# Altium schematic sheet 07_Storage.SchDoc
size 812 x 508 mm; SheetNumber: 7; SheetTotal: 16
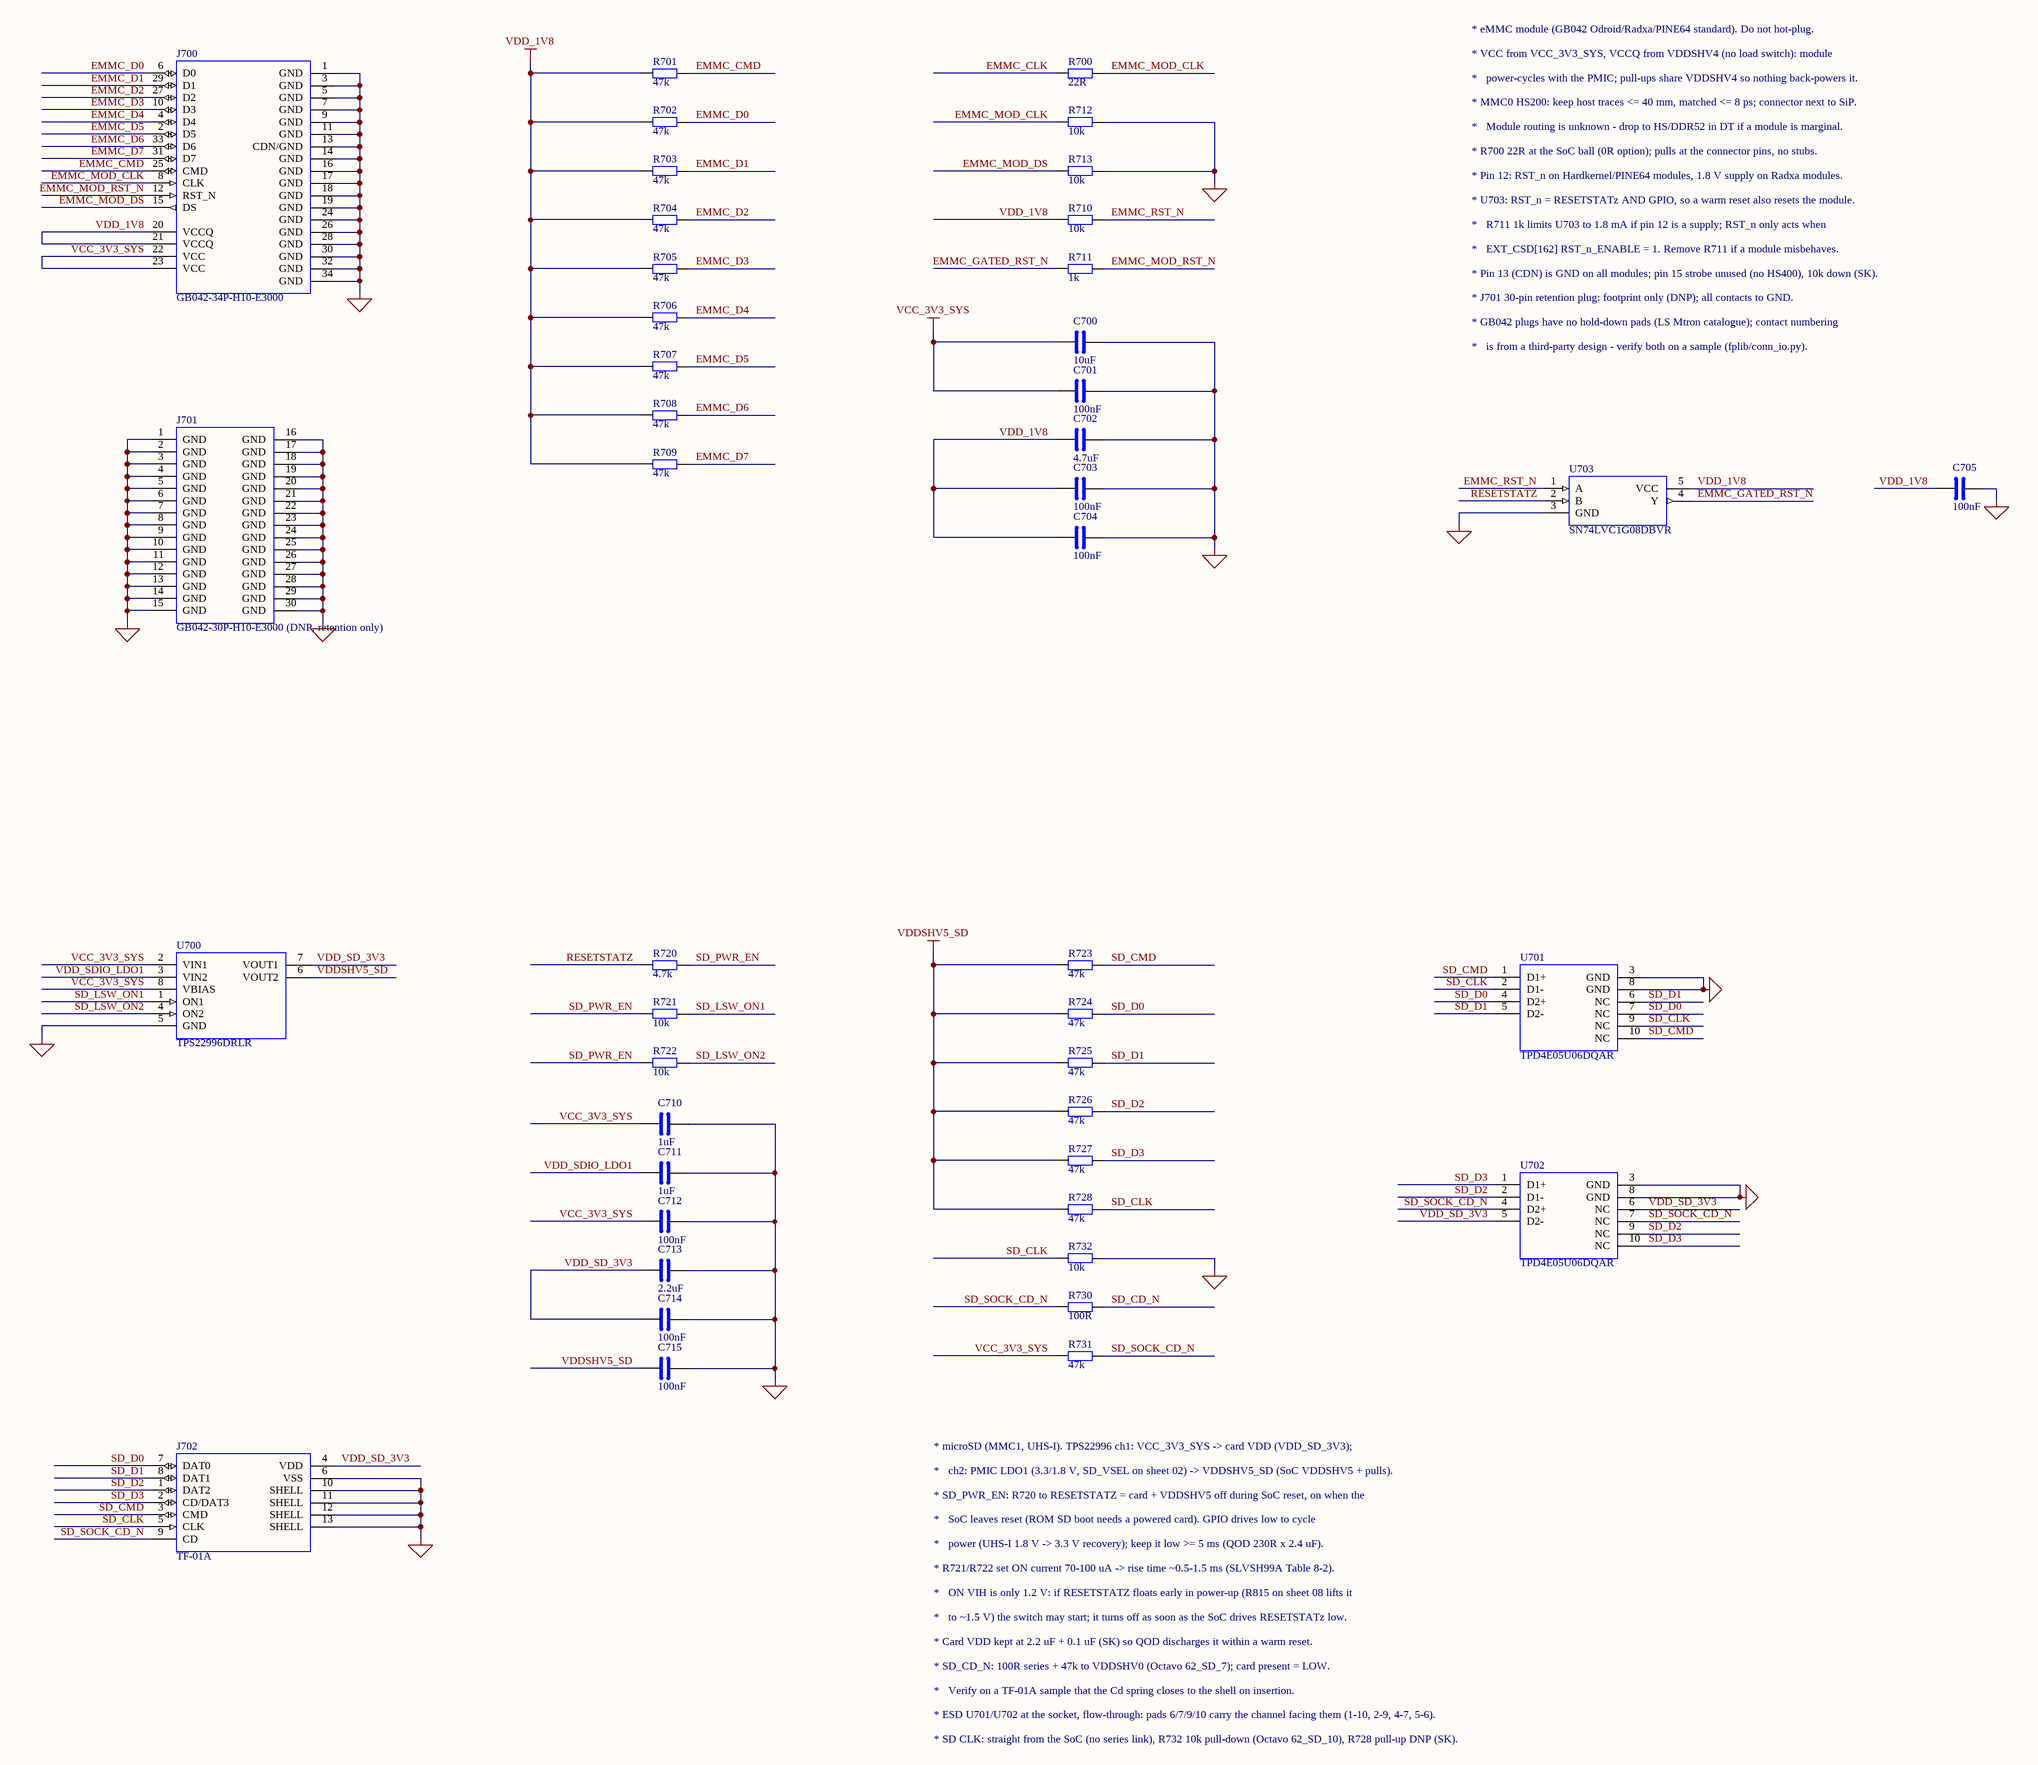
[diagram p0: 07_Storage.SchDoc]

## Parts
C700  10uF  [C0603]
C701  100nF  [C0402]
C702  4.7uF  [C0603]
C703  100nF  [C0402]
C704  100nF  [C0402]
C705  100nF  [C0402]
C710  1uF  [C0402]
C711  1uF  [C0402]
C712  100nF  [C0402]
C713  2.2uF  [C0402]
C714  100nF  [C0402]
C715  100nF  [C0402]
J700  GB042-34P-H10-E3000  [B2B_LSM_GB042-34P-H10]
J701  GB042-30P-H10-E3000 (DNP, retention only)  [B2B_LSM_GB042-30P-H10]
J702  TF-01A  [MICROSD_HRO_TF-01A]
R700  22R  [R0402]
R701  47k  [R0402]
R702  47k  [R0402]
R703  47k  [R0402]
R704  47k  [R0402]
R705  47k  [R0402]
R706  47k  [R0402]
R707  47k  [R0402]
R708  47k  [R0402]
R709  47k  [R0402]
R710  10k  [R0402]
R711  1k  [R0402]
R712  10k  [R0402]
R713  10k  [R0402]
R720  4.7k  [R0402]
R721  10k  [R0402]
R722  10k  [R0402]
R723  47k  [R0402]
R724  47k  [R0402]
R725  47k  [R0402]
R726  47k  [R0402]
R727  47k  [R0402]
R728  47k  [R0402]
R730  100R  [R0402]
R731  47k  [R0402]
R732  10k  [R0402]
U700  TPS22996DRLR  [SOT583-8]
U701  TPD4E05U06DQAR  [USON10_DQA]
U702  TPD4E05U06DQAR  [USON10_DQA]
U703  SN74LVC1G08DBVR  [SOT23-5]

## Nets
GND: C700.2 C701.2 C702.2 C703.2 C704.2 C705.2 C710.2 C711.2 C712.2 C713.2 C714.2 C715.2 J700.1(GND) J700.3(GND) J700.5(GND) J700.7(GND) J700.9(GND) J700.11(GND) J700.13(CDN/GND) J700.14(GND) J700.16(GND) J700.17(GND) J700.18(GND) J700.19(GND) J700.24(GND) J700.26(GND) J700.28(GND) J700.30(GND) J700.32(GND) J700.34(GND) J701.1(GND) J701.2(GND) J701.3(GND) J701.4(GND) J701.5(GND) J701.6(GND) J701.7(GND) J701.8(GND) J701.9(GND) J701.10(GND) J701.11(GND) J701.12(GND) J701.13(GND) J701.14(GND) J701.15(GND) J701.16(GND) J701.17(GND) J701.18(GND) J701.19(GND) J701.20(GND) J701.21(GND) J701.22(GND) J701.23(GND) J701.24(GND) J701.25(GND) J701.26(GND) J701.27(GND) J701.28(GND) J701.29(GND) J701.30(GND) J702.6(VSS) J702.10(SHELL) J702.11(SHELL) J702.12(SHELL) J702.13(SHELL) R712.2 R713.2 R732.2 U700.5(GND) U701.3(GND) U701.8(GND) U702.3(GND) U702.8(GND) U703.3(GND)
VCC_3V3_SYS: C700.1 C701.1 C710.1 C712.1 J700.22(VCC) J700.23(VCC) R731.1 U700.2(VIN1) U700.8(VBIAS)
VDD_1V8: C702.1 C703.1 C704.1 C705.1 J700.20(VCCQ) J700.21(VCCQ) R701.1 R702.1 R703.1 R704.1 R705.1 R706.1 R707.1 R708.1 R709.1 R710.1 U703.5(VCC)
VDDSHV5_SD: C715.1 R723.1 R724.1 R725.1 R726.1 R727.1 R728.1 U700.6(VOUT2)
EMMC_CLK: R700.1
EMMC_CMD: J700.25(CMD) R701.2
EMMC_D0: J700.6(D0) R702.2
EMMC_D1: J700.29(D1) R703.2
EMMC_D2: J700.27(D2) R704.2
EMMC_D3: J700.10(D3) R705.2
EMMC_D4: J700.4(D4) R706.2
EMMC_D5: J700.2(D5) R707.2
EMMC_D6: J700.33(D6) R708.2
EMMC_D7: J700.31(D7) R709.2
EMMC_GATED_RST_N: R711.1 U703.4(Y)
EMMC_MOD_CLK: J700.8(CLK) R700.2 R712.1
EMMC_MOD_DS: J700.15(DS) R713.1
EMMC_MOD_RST_N: J700.12(RST_N) R711.2
EMMC_RST_N: R710.2 U703.1(A)
RESETSTATZ: R720.1 U703.2(B)
SD_CD_N: R730.2
SD_CLK: J702.5(CLK) R728.2 R732.1 U701.2(D1-) U701.9(NC)
SD_CMD: J702.3(CMD) R723.2 U701.1(D1+) U701.10(NC)
SD_D0: J702.7(DAT0) R724.2 U701.4(D2+) U701.7(NC)
SD_D1: J702.8(DAT1) R725.2 U701.5(D2-) U701.6(NC)
SD_D2: J702.1(DAT2) R726.2 U702.2(D1-) U702.9(NC)
SD_D3: J702.2(CD/DAT3) R727.2 U702.1(D1+) U702.10(NC)
SD_LSW_ON1: R721.2 U700.1(ON1)
SD_LSW_ON2: R722.2 U700.4(ON2)
SD_PWR_EN: R720.2 R721.1 R722.1
SD_SOCK_CD_N: J702.9(CD) R730.1 R731.2 U702.4(D2+) U702.7(NC)
VDD_SD_3V3: C713.1 C714.1 J702.4(VDD) U700.7(VOUT1) U702.5(D2-) U702.6(NC)
VDD_SDIO_LDO1: C711.1 U700.3(VIN2)

## Notes on the sheet
- * eMMC module (GB042 Odroid/Radxa/PINE64 standard). Do not hot-plug.
- * VCC from VCC_3V3_SYS, VCCQ from VDDSHV4 (no load switch): module
- *   power-cycles with the PMIC; pull-ups share VDDSHV4 so nothing back-powers it.
- * MMC0 HS200: keep host traces <= 40 mm, matched <= 8 ps; connector next to SiP.
- *   Module routing is unknown - drop to HS/DDR52 in DT if a module is marginal.
- * R700 22R at the SoC ball (0R option); pulls at the connector pins, no stubs.
- * Pin 12: RST_n on Hardkernel/PINE64 modules, 1.8 V supply on Radxa modules.
- * U703: RST_n = RESETSTATz AND GPIO, so a warm reset also resets the module.
- *   R711 1k limits U703 to 1.8 mA if pin 12 is a supply; RST_n only acts when
- *   EXT_CSD[162] RST_n_ENABLE = 1. Remove R711 if a module misbehaves.
- * Pin 13 (CDN) is GND on all modules; pin 15 strobe unused (no HS400), 10k down (SK).
- * J701 30-pin retention plug: footprint only (DNP); all contacts to GND.
- * GB042 plugs have no hold-down pads (LS Mtron catalogue); contact numbering
- *   is from a third-party design - verify both on a sample (fplib/conn_io.py).
- * microSD (MMC1, UHS-I). TPS22996 ch1: VCC_3V3_SYS -> card VDD (VDD_SD_3V3);
- *   ch2: PMIC LDO1 (3.3/1.8 V, SD_VSEL on sheet 02) -> VDDSHV5_SD (SoC VDDSHV5 + pulls).
- * SD_PWR_EN: R720 to RESETSTATZ = card + VDDSHV5 off during SoC reset, on when the
- *   SoC leaves reset (ROM SD boot needs a powered card). GPIO drives low to cycle
- *   power (UHS-I 1.8 V -> 3.3 V recovery); keep it low >= 5 ms (QOD 230R x 2.4 uF).
- * R721/R722 set ON current 70-100 uA -> rise time ~0.5-1.5 ms (SLVSH99A Table 8-2).
- *   ON VIH is only 1.2 V: if RESETSTATZ floats early in power-up (R815 on sheet 08 lifts it
- *   to ~1.5 V) the switch may start; it turns off as soon as the SoC drives RESETSTATz low.
- * Card VDD kept at 2.2 uF + 0.1 uF (SK) so QOD discharges it within a warm reset.
- * SD_CD_N: 100R series + 47k to VDDSHV0 (Octavo 62_SD_7); card present = LOW.
- *   Verify on a TF-01A sample that the Cd spring closes to the shell on insertion.
- * ESD U701/U702 at the socket, flow-through: pads 6/7/9/10 carry the channel facing them (1-10, 2-9, 4-7, 5-6).
- * SD CLK: straight from the SoC (no series link), R732 10k pull-down (Octavo 62_SD_10), R728 pull-up DNP (SK).

## Library data of the parts
C700 = CAP: Capacitor, non-polarized; Spec: 10uF 10V X5R 0603 (VCC)
C701 = CAP: Capacitor, non-polarized; Spec: 100nF 16V X7R 0402 (VCC)
C702 = CAP: Capacitor, non-polarized; Spec: 4.7uF 10V X5R 0603 (VCCQ)
C703 = CAP: Capacitor, non-polarized; Spec: 100nF 16V X7R 0402 (VCCQ pin 20)
C704 = CAP: Capacitor, non-polarized; Spec: 100nF 16V X7R 0402 (VCCQ pin 21)
C705 = CAP: Capacitor, non-polarized; Spec: 100nF 16V X7R 0402 (U703 VCC)
C710 = CAP: Capacitor, non-polarized; Spec: 1uF 25V X5R 0402 (VIN1)
C711 = CAP: Capacitor, non-polarized; Spec: 1uF 25V X5R 0402 (VIN2)
C712 = CAP: Capacitor, non-polarized; Spec: 100nF 16V X7R 0402 (VBIAS)
C713 = CAP: Capacitor, non-polarized; Spec: 2.2uF 10V X5R 0402 (card VDD)
C714 = CAP: Capacitor, non-polarized; Spec: 100nF 16V X7R 0402 (card VDD)
C715 = CAP: Capacitor, non-polarized; Spec: 100nF 16V X7R 0402 (VOUT2)
J700 = GB042-34P-H10: eMMC-module connector, LS Mtron GB042 34-pin 0.4 mm B2B plug (Odroid/Radxa/PINE64 pinout); MPN: GB042-34P-H10-E3000; Manufacturer: LS Mtron; Supplier: broker, consigned to JLC (STOCK RISK)
J701 = GB042-30P-H10: eMMC-module retention connector, LS Mtron GB042 30-pin 0.4 mm B2B plug (mechanical, all GND); DNP: 1; MPN: GB042-30P-H10-E3000; Manufacturer: LS Mtron
J702 = TF-01A: microSD push-push socket with card-detect switch (Hroparts TF-01A); Manufacturer: Korean Hroparts Elec; MPN: TF-01A; LCSC: C91145
R700 = RES: Resistor; Spec: 22R 0402 (at SoC; 0R option)
R701-R709 R723-R727 = RES: Resistor; Spec: 47k 0402
R710 = RES: Resistor; Spec: 10k 0402 (GPIO pull-up: reset follows RESETSTATz by default)
R711 = RES: Resistor; Spec: 1k 0402 (RST_n link, see note)
R712 = RES: Resistor; Spec: 10k 0402 (CLK pull-down, at pin 8)
R713 = RES: Resistor; Spec: 10k 0402 (strobe pull-down)
R720 = RES: Resistor; Spec: 4.7k 0402 (SD power follows RESETSTATz)
R721 = RES: Resistor; Spec: 10k 0402 (RT1 rise time)
R722 = RES: Resistor; Spec: 10k 0402 (RT2 rise time)
R728 = RES: Resistor; DNP: 1; Spec: 47k 0402 (DNP)
R730 = RES: Resistor; Spec: 100R 0402 (SDCD series)
R731 = RES: Resistor; Spec: 47k 0402 (SDCD pull-up)
R732 = RES: Resistor; Spec: 10k 0402 (CLK pull-down, Octavo 62_SD_10)
U700 = TPS22996_DRL: TPS22996 dual 4 A load switch with QOD and ON-current set rise time, SOT-583-8; Manufacturer: Texas Instruments; MPN: TPS22996DRLR
U701 U702 = TPD4E05U06_DQA: 4-channel 0.5 pF ESD array, USON-10; Manufacturer: Texas Instruments; MPN: TPD4E05U06DQAR
U703 = SN74LVC1G08_DBV: Single 2-input AND gate, SOT-23-5; Manufacturer: Texas Instruments; MPN: SN74LVC1G08DBVR; LCSC: C7666